# Altium schematic sheet Power_Section.SchDoc
size A; DocumentNumber: 7; SheetNumber: 7; SheetTotal: 8
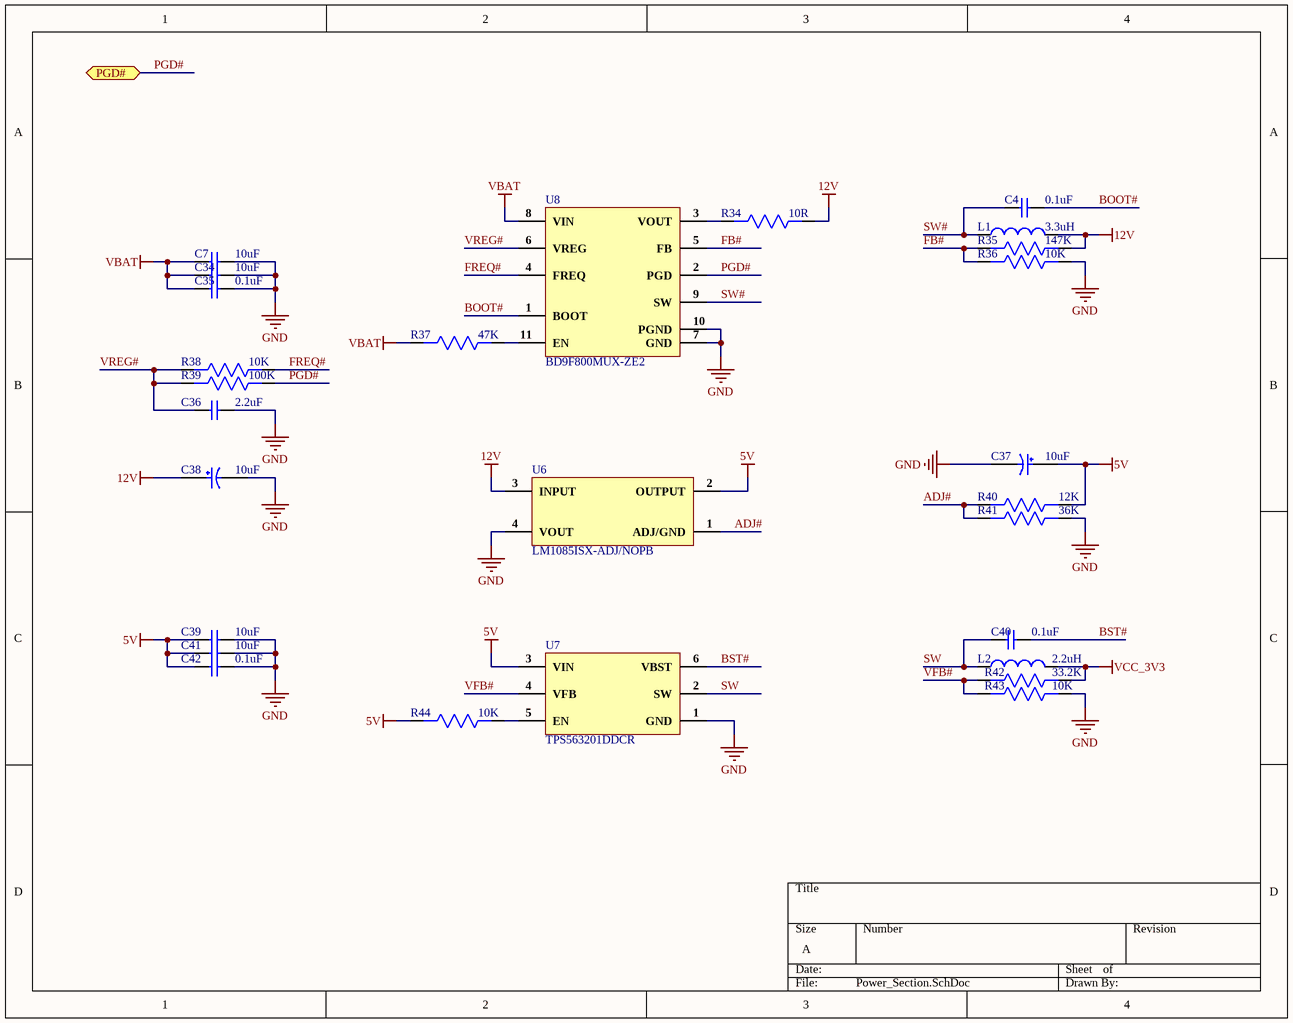
[diagram p0: Power_Section.SchDoc]

## Parts
C4  0.1uF  [CAP 0402]
C7  10uF  [Cap1206]
C34  10uF  [Cap1206]
C35  0.1uF  [CAP 0402]
C36  2.2uF  [Cap0603]
C37  10uF  [Cap Case-A]
C38  10uF  [Cap Tant 2917]
C39  10uF  [Cap0402]
C40  0.1uF  [CAP 0402]
C41  10uF  [Cap0402]
C42  0.1uF  [CAP 0402]
L1  3.3uH  [GCDA1040-3R3MC]
L2  value 2.2uH  [MS0530-2R2M]  (hidden comment: MS0530-2R2M)
R34  10R  [Res0402]
R35  147K  [Res0402]
R36  10K  [Res-0201]
R37  47K  [Res0402]
R38  10K  [Res-0201]
R39  100K  [Res0402]
R40  12K  [Res0402]
R41  36K  [Res0402]
R42  33.2K  [Res0402]
R43  10K  [Res0402]
R44  10K  [Res-0201]
U6  LM1085ISX-ADJ/NOPB  [DDPAK/TO-263-3]
U7  TPS563201DDCR  [TPS563201DDCR]
U8  BD9F800MUX-ZE2

## Ports
PGD# (bidir)

## Nets
5V: C37.1 C39.1 C41.1 C42.1 R40.1 R44.2 U6.2(OUTPUT) U7.3(VIN)
12V: C38.1 L1.2 R34.1 R35.1 U6.3(INPUT)
GND: C7.2 C34.2 C35.2 C36.2 C37.2 C38.2 C39.2 C41.2 C42.2 R36.1 R41.1 R43.1 U6.4(VOUT) U7.1(GND) U8.7(GND) U8.10(PGND)
VBAT: C7.1 C34.1 C35.1 R37.2 U8.8(VIN)
VCC_3V3: L2.2 R42.2
ADJ#: R40.2 R41.2 U6.1(ADJ/GND)
BOOT#: C4.2 U8.1(BOOT)
BST#: C40.2 U7.6(VBST)
FB#: R35.2 R36.2 U8.5(FB)
FREQ#: R38.1 U8.4(FREQ)
PGD#: R39.1 U8.2(PGD) ; port PGD#
SW: C40.1 L2.1 U7.2(SW)
SW#: C4.1 L1.1 U8.9(SW)
VFB#: R42.1 R43.2 U7.4(VFB)
VREG#: C36.1 R38.2 R39.2 U8.6(VREG)
NetR34_2: R34.2 U8.3(VOUT)
NetR37_1: R37.1 U8.11(EN)
NetR44_1: R44.1 U7.5(EN)

## Library data of the parts
C4 C35 C40 C42 = CL05B104KB54PNC: CAP CER 0.1UF 50V X7R 0402; Manufacturer: Samsung; Supplier 1: Digi-Key; Manufacturer Part Number: CL05B104KB54PNC; Stock 1: 8594; Pricing 1: 1=0.1, 10=0.067, 50=0.0366, 100=0.0299, 500=0.02138, 1000=0.01681, 2500=0.01528, 5000=0.01406 (USD); Supplier Part Number 1: 1276-CL05B104KB54PNCDKR-ND
C7 C34 = CL31B106KBHNNNE: CAP CER 10UF 50V X7R 1206; Manufacturer: Samsung; Tolerance: 10%; Supplier 1: Digi-Key; Manufacturer Part Number: CL31B106KBHNNNE; Stock 1: 177239; Pricing 1: 1=0.39, 10=0.268, 50=0.1872, 100=0.1605, 500=0.12038, 1000=0.10166 (USD); Mount: Surface Mount; Case/Package: 1206; Case Code (Metric): 3216; Case Code (Imperial): 1206; Min Operating Temperature: -55°C; Max Operating Temperature: 125°C; Capacitance: 10uF; Dielectric: X7R; Voltage Rating (DC): 50V; Packaging: Tape and Reel; Voltage Rating: 50V; Length: 0.126inch; Width: 0.063inch; Thickness: 0.071inch; Lead Free: Lead Free; ComponentLink1URL: http://www.samsungsem.com/kr/support/product-search/mlcc/CL31B106KBHNNNE.jsp?src-supplier=Digi-Key; ComponentLink1Description: http://www.samsungsem.com/kr/support/product-search/mlcc/CL31B106KBHNNNE.jsp?src-supplier=Digi-Key; Supplier Part Number 1: 1276-6767-1-ND
C36 = GRM188R61E225MA12D: CAP CER 2.2UF 25V X5R 0603; Manufacturer: Murata; Tolerance: 20%; Supplier 1: Digi-Key; Manufacturer Part Number: GRM188R61E225MA12D; Stock 1: 152000; Pricing 1: 4000=0.02107, 8000=0.0196 (USD); Mount: Surface Mount; Case/Package: 0603; Weight: 0.000222oz; Case Code (Metric): 1608; Case Code (Imperial): 0603; Min Operating Temperature: -55°C; Max Operating Temperature: 85°C; Capacitance: 2.2uF; Packaging: Tape and Reel; Voltage Rating: 25V; Dielectric: X5R; Termination: SMD/SMT; Composition: Ceramic; Voltage Rating (DC): 25V; Package Quantity: 4000; Length: 0.063inch; Height: 0.8mm; Width: 0.031inch; Thickness: 0.035inch; ComponentLink1URL: http://search.murata.co.jp/Ceramy/image/img/A01X/G101/ENG/GRM188R61E225MA12-01.pdf?src-supplier=Digi-Key; ComponentLink1Description: http://search.murata.co.jp/Ceramy/image/img/A01X/G101/ENG/GRM188R61E225MA12-01.pdf?src-supplier=Digi-Key; ComponentLink2URL: http://www.mouser.com/ds/2/281/c02e-2905.pdf?src-supplier=Mouser; ComponentLink2Description: http://www.mouser.com/ds/2/281/c02e-2905.pdf?src-supplier=Mouser; Supplier Part Number 1: 490-12738-2-ND
C37 = TAJA106K016RNJ: CAP TANT 10UF 10% 16V 1206; Manufacturer: Kyocera AVX; Dielectric Material: Tantalum; ESR (Equivalent Series Resistance): 3R; Leakage Current: 1.6uA; Dissipation Factor: 8%; Polarity: Polar; Supplier 1: Digi-Key; Manufacturer Part Number: TAJA106K016RNJ; Stock 1: 0; Pricing 1: 1=0.3, 10=0.209, 50=0.1464, 100=0.1254, 500=0.09406, 1000=0.07942 (USD); Mount: Surface Mount,PCB; Case/Package: 1206; Number of Pins: 2; Case Code (Metric): 3216; Case Code (Imperial): 1206; Min Operating Temperature: -55°C; Max Operating Temperature: 125°C; Capacitance: 10uF; Tolerance: 10%; Packaging: Tape and Reel; Voltage Rating (DC): 16V; Package Quantity: 1; Voltage Rating: 16V; Termination: SMD/SMT; Voltage: 16V; Features: General Purpose; Length: 3.2mm; Height: 1.6mm; Depth: 1.6mm; Width: 1.6mm; Height - Seated (Max): 0.071inch; Lead Pitch: 1.1mm; Radiation Hardening: No; Lead Free: Lead Free; REACH SVHC: No SVHC; ComponentLink1URL: http://catalogs.avx.com/TantalumNiobium.pdf?src-supplier=Digi-Key; ComponentLink1Description: http://catalogs.avx.com/TantalumNiobium.pdf?src-supplier=Digi-Key; ComponentLink2URL: http://www.avx.com/docs/catalogs/taj.pdf?src-supplier=Avnet; ComponentLink2Description: http://www.avx.com/docs/catalogs/taj.pdf?src-supplier=Avnet; ComponentLink3URL: http://www.avxcorp.com/docs/Catalogs/taj.pdf?src-supplier=Future+Electronics; ComponentLink3Description: http://www.avxcorp.com/docs/Catalogs/taj.pdf?src-supplier=Future+Electronics; ComponentLink4URL: http://www.farnell.com/datasheets/2237755.pdf?src-supplier=Element14; ComponentLink4Description: http://www.farnell.com/datasheets/2237755.pdf?src-supplier=Element14; ComponentLink5URL: http://www.jameco.com/Jameco/Products/ProdDS/1234933.pdf?src-supplier=Jameco; ComponentLink5Description: http://www.jameco.com/Jameco/Products/ProdDS/1234933.pdf?src-supplier=Jameco; ComponentLink6URL: http://www.mouser.com/ds/2/40/taj-776811.pdf?src-supplier=Mouser; ComponentLink6Description: http://www.mouser.com/ds/2/40/taj-776811.pdf?src-supplier=Mouser; ComponentLink7URL: https://www.distrelec.biz/Web/Downloads/_e/ng/taj_ENG.pdf?mime=application%2Fpdf&src-supplier=Distrelec; ComponentLink7Description: https://www.distrelec.biz/Web/Downloads/_e/ng/taj_ENG.pdf?mime=application%2Fpdf&src-supplier=Distrelec; ComponentLink8URL: http://www.avx.com/docs/Catalogs/taj.pdf?src-supplier=Element14; ComponentLink8Description: http://www.avx.com/docs/Catalogs/taj.pdf?src-supplier=Element14; ComponentLink9URL: https://produktinfo.conrad.com/datenblaetter/550000-574999/559411-da-01-en-TACC_A__3_2_MM_X_1_6_MM_X_1_6_MM__10_UF_.pdf?src-supplier=Conrad; ComponentLink9Description: https://produktinfo.conrad.com/datenblaetter/550000-574999/559411-da-01-en-TACC_A__3_2_MM_X_1_6_MM_X_1_6_MM__10_UF_.pdf?src-supplier=Conrad; Supplier Part Number 1: 478-1655-1-ND
C38 = TAJD106K050RNJ: CAP TANT 10UF 10% 50V 2917; Manufacturer: Kyocera AVX; Dielectric Material: Tantalum; ESR (Equivalent Series Resistance): 800mR; Leakage Current: 5uA; Polarity: Polar; Dissipation Factor: 6%; Supplier 1: Digi-Key; Manufacturer Part Number: TAJD106K050RNJ; Stock 1: 0; Pricing 1: 1=1.84, 10=1.452, 50=1.2584, 100=1.089 (USD); Mount: Surface Mount,PCB; Case/Package: 2917; Number of Pins: 2; Case Code (Metric): 7343; Case Code (Imperial): 2917; Min Operating Temperature: -55°C; Max Operating Temperature: 125°C; Capacitance: 10uF; Tolerance: 10%; Voltage Rating (DC): 50V; Voltage Rating: 50V; Package Quantity: 1; Packaging: Tape and Reel; Termination: SMD/SMT; Voltage: 50V; Features: General Purpose; Length: 7.3mm; Height: 2.9mm; Depth: 4.3mm; Width: 0.169inch; Height - Seated (Max): 0.122inch; Radiation Hardening: No; Lead Free: Lead Free; REACH SVHC: No SVHC; ComponentLink1URL: http://datasheets.avx.com/TAJ.pdf?src-supplier=Digi-Key; ComponentLink1Description: http://datasheets.avx.com/TAJ.pdf?src-supplier=Digi-Key; ComponentLink2URL: http://www.mouser.com/ds/2/40/taj-776811.pdf?src-supplier=Mouser; ComponentLink2Description: http://www.mouser.com/ds/2/40/taj-776811.pdf?src-supplier=Mouser; ComponentLink3URL: http://www.farnell.com/datasheets/49917.pdf?src-supplier=Element14; ComponentLink3Description: http://www.farnell.com/datasheets/49917.pdf?src-supplier=Element14; ComponentLink4URL: http://www.avx.com/docs/Catalogs/taj.pdf?src-supplier=Element14; ComponentLink4Description: http://www.avx.com/docs/Catalogs/taj.pdf?src-supplier=Element14; ComponentLink5URL: http://documents.rs-components.com/techlib://itc_doclist_GB.htm?stockno=6993166&src-supplier=RSComponents; ComponentLink5Description: http://documents.rs-components.com/techlib://itc_doclist_GB.htm?stockno=6993166&src-supplier=RSComponents; ComponentLink6URL: http://www.farnell.com/datasheets/1826076.pdf?src-supplier=Element14; ComponentLink6Description: http://www.farnell.com/datasheets/1826076.pdf?src-supplier=Element14; ComponentLink7URL: http://www.avx.com/docs/catalogs/taj.pdf?src-supplier=Avnet; ComponentLink7Description: http://www.avx.com/docs/catalogs/taj.pdf?src-supplier=Avnet; ComponentLink8URL: https://www.alliedelec.com/m/d/9166fb755e7ffffad4c533f86d810ce4.pdf?src-supplier=Allied+Electronics; ComponentLink8Description: https://www.alliedelec.com/m/d/9166fb755e7ffffad4c533f86d810ce4.pdf?src-supplier=Allied+Electronics; ComponentLink9URL: http://www.avx.com/docs/Catalogs/taj.pdf?src-supplier=Farnell; ComponentLink9Description: http://www.avx.com/docs/Catalogs/taj.pdf?src-supplier=Farnell; Supplier Part Number 1: 478-2380-1-ND
C39 C41 = CL05A106MP8NUB8: CAP CER 10UF 10V X5R 0402; Manufacturer: Samsung; Tolerance: 20%; Supplier 1: Digi-Key; Manufacturer Part Number: CL05A106MP8NUB8; Stock 1: 1158256; Pricing 1: 1=0.45, 10=0.311, 100=0.1863, 500=0.13972, 1000=0.11799, 2500=0.11178 (USD); Mount: Surface Mount; Case/Package: 0402; Case Code (Metric): 1005; Case Code (Imperial): 0402; Min Operating Temperature: -55°C; Max Operating Temperature: 85°C; Packaging: Tape and Reel; Capacitance: 10uF; Voltage Rating: 10V; Length: 0.039inch; Width: 0.02inch; Thickness: 0.035inch; Supplier Part Number 1: 1276-6830-1-ND
L1 = GCDA1040-3R3MC: 3.3uH ±20% 10A 11.8mΩ SMD,11x10.2x4mm Inductors (SMD) RoHS; Manufacturer: GLE; Manufacturer Part No: GCDA1040-3R3MC; Value: 3.3uH; Package: SMD,11x10.2x4mm
L2 = MS0530-2R2M: 2.2uH ±20% 5.5A 29mΩ SMD,5.75x5.2x3mm Inductors (SMD) RoHS; Manufacturer: COILMX; Manufacturer Part No: MS0530-2R2M; Package: Custom
R34 = RC0402JR-0710RL: RES SMD 10 OHM 5% 1/16W 0402; Manufacturer: Yageo; Power Rating: 63mW; Voltage Rating: 50V; Temperature Coefficient: 200ppm/°C; Supplier 1: Digi-Key; Manufacturer Part Number: RC0402JR-0710RL; Stock 1: 1336134; Pricing 1: 1=0.1, 10=0.018, 100=0.0073, 1000=0.0033, 2500=0.0029, 5000=0.0024 (USD); Case/Package: 0402; Case Code (Imperial): 0402; Case Code (Metric): 1005; Min Operating Temperature: -55°C; Max Operating Temperature: 155°C; Resistance: 10R; Tolerance: 5%; Packaging: Tape and Reel; Composition: Thick Film; Package Quantity: 1; Termination: SMD/SMT; Number of Terminations: 2; Military Standard: Not; Max Power Dissipation: 63mW; Working Voltage: 50V; Features: Moisture Resistant; Length: 1mm; Height: 0.016inch; Width: 0.02inch; Depth: 0.5mm; REACH SVHC: Unknown; Lead Free: Lead Free; ComponentLink1URL: http://www.farnell.com/datasheets/1018594.pdf?src-supplier=Element14; ComponentLink1Description: http://www.farnell.com/datasheets/1018594.pdf?src-supplier=Element14; ComponentLink2URL: http://www.yageo.com/documents/recent/PYu-RC_Group_51_RoHS_L_10.pdf?src-supplier=Digi-Key; ComponentLink2Description: http://www.yageo.com/documents/recent/PYu-RC_Group_51_RoHS_L_10.pdf?src-supplier=Digi-Key; ComponentLink3URL: http://www.farnell.com/datasheets/2167052.pdf?src-supplier=Element14; ComponentLink3Description: http://www.farnell.com/datasheets/2167052.pdf?src-supplier=Element14; ComponentLink4URL: http://www.yageo.com/documents/recent/PYu-RC0402_51_RoHS_L_6_r.pdf?src-supplier=Future+Electronics; ComponentLink4Description: http://www.yageo.com/documents/recent/PYu-RC0402_51_RoHS_L_6_r.pdf?src-supplier=Future+Electronics; Supplier Part Number 1: 311-10JRCT-ND
R35 = RC0402FR-07147KL: RES SMD 147K OHM 1% 1/16W 0402; Manufacturer: Yageo; Resistance: 147kR; Power Rating: 62.5mW; Voltage Rating: 50V; Max Power Dissipation: 63mW; Temperature Coefficient: 100ppm/°C; Supplier 1: Digi-Key; Manufacturer Part Number: RC0402FR-07147KL; Stock 1: 250520; Pricing 1: 1=0.1, 10=0.015, 100=0.0062, 1000=0.00278, 2500=0.00242, 5000=0.002 (USD); Case/Package: 0402; Case Code (Imperial): 0402; Case Code (Metric): 1005; Min Operating Temperature: -55°C; Max Operating Temperature: 155°C; Tolerance: 1%; Packaging: Tape and Reel; Composition: Thick Film; Number of Terminations: 2; Termination: SMD/SMT; Military Standard: Not; Voltage Rating (DC): 50V; Features: Moisture Resistant; Length: 1mm; Height: 0.016inch; Width: 0.02inch; Depth: 0.5mm; Lead Free: Lead Free; ComponentLink1URL: https://www.verical.com/server-webapp/html/getDatasheet?partID=329230&src-supplier=Verical; ComponentLink1Description: https://www.verical.com/server-webapp/html/getDatasheet?partID=329230&src-supplier=Verical; ComponentLink2URL: http://www.yageo.com/documents/recent/PYu-RC0402_51_RoHS_L_6_r.pdf?src-supplier=Future+Electronics; ComponentLink2Description: http://www.yageo.com/documents/recent/PYu-RC0402_51_RoHS_L_6_r.pdf?src-supplier=Future+Electronics; Supplier Part Number 1: YAG2981CT-ND
R36 R38 R44 = RC0201JR-0710KL: RES SMD 10K OHM 5% 1/20W 0201; Manufacturer: Yageo; Resistance: 10kR; Temperature Coefficient: 200ppm/°C; Power Rating: 50mW; Voltage Rating: 25V; Supplier 1: Digi-Key; Manufacturer Part Number: RC0201JR-0710KL; Stock 1: 1378070; Pricing 1: 1=0.1, 10=0.028, 100=0.0115, 1000=0.00517, 2500=0.00448, 5000=0.00371 (USD); Case/Package: 0201; Contact Plating: Tin,Matte; Case Code (Imperial): 0201; Case Code (Metric): 0603; Min Operating Temperature: -55°C; Max Operating Temperature: 125°C; Tolerance: 5%; Composition: Thick Film; Packaging: Tape and Reel; Termination: SMD/SMT; Military Standard: Not; Voltage Rating (DC): 25V; Length: 0.6mm; Depth: 0.3mm; Radiation Hardening: No; REACH SVHC: Unknown; Lead Free: Lead Free; ComponentLink1URL: http://www.farnell.com/datasheets/2167052.pdf?src-supplier=Element14; ComponentLink1Description: http://www.farnell.com/datasheets/2167052.pdf?src-supplier=Element14; ComponentLink2URL: http://www.yageo.com/documents/recent/PYu-RC0201_51_RoHS_L_8.pdf?src-supplier=Avnet+Europe; ComponentLink2Description: http://www.yageo.com/documents/recent/PYu-RC0201_51_RoHS_L_8.pdf?src-supplier=Avnet+Europe; ComponentLink3URL: http://www.yageo.com/documents/recent/PYu-RC0201_51_RoHS_L_8.pdf?src-supplier=Avnet; ComponentLink3Description: http://www.yageo.com/documents/recent/PYu-RC0201_51_RoHS_L_8.pdf?src-supplier=Avnet; Supplier Part Number 1: 311-10KNDKR-ND
R37 = ERJ-2RKF4702X: RES SMD 47K OHM 1% 1/10W 0402; Manufacturer: Panasonic; Resistance: 47kR; Temperature Coefficient: 100ppm/°C; Voltage Rating: 50V; Power Rating: 100mW; Supplier 1: Digi-Key; Manufacturer Part Number: ERJ-2RKF4702X; Stock 1: 1741209; Pricing 1: 1=0.1, 10=0.045, 100=0.0183, 1000=0.00822, 2500=0.00713, 5000=0.00589 (USD); Mount: Surface Mount; Case/Package: 0402; Number of Pins: 2; Contact Plating: Tin; Case Code (Imperial): 0402; Case Code (Metric): 1005; Min Operating Temperature: -55°C; Max Operating Temperature: 155°C; Tolerance: 1%; Composition: Thick Film; Packaging: Tape and Reel; Package Quantity: 1; Termination: SMD/SMT; Number of Terminations: 2; Military Standard: Not; Max Power Dissipation: 100mW; Voltage Rating (DC): 50V; Features: Automotive AEC-Q200; Length: 1mm; Height: 0.35mm; Width: 0.5mm; Depth: 0.5mm; Radiation Hardening: No; REACH SVHC: No SVHC; Lead Free: Lead Free; ComponentLink1URL: http://www.farnell.com/datasheets/1911175.pdf?src-supplier=Element14; ComponentLink1Description: http://www.farnell.com/datasheets/1911175.pdf?src-supplier=Element14; ComponentLink2URL: http://industrial.panasonic.com/www-data/pdf/AOA0000/AOA0000CE2.pdf?src-supplier=Avnet; ComponentLink2Description: http://industrial.panasonic.com/www-data/pdf/AOA0000/AOA0000CE2.pdf?src-supplier=Avnet; ComponentLink3URL: http://industrial.panasonic.com/www-data/pdf/AOA0000/AOA0000CE2.pdf?src-supplier=Avnet+Asia; ComponentLink3Description: http://industrial.panasonic.com/www-data/pdf/AOA0000/AOA0000CE2.pdf?src-supplier=Avnet+Asia; ComponentLink4URL: http://www.farnell.com/datasheets/1678782.pdf?src-supplier=Element14; ComponentLink4Description: http://www.farnell.com/datasheets/1678782.pdf?src-supplier=Element14; ComponentLink5URL: http://industrial.panasonic.com/www-data/pdf/AOA0000/AOA0000CE2.pdf?src-supplier=Element14; ComponentLink5Description: http://industrial.panasonic.com/www-data/pdf/AOA0000/AOA0000CE2.pdf?src-supplier=Element14; ComponentLink6URL: https://www.alliedelec.com/m/d/623f45ff1957d936ff56d46fd1c28cac.pdf?src-supplier=Allied+Electronics; ComponentLink6Description: https://www.alliedelec.com/m/d/623f45ff1957d936ff56d46fd1c28cac.pdf?src-supplier=Allied+Electronics; ComponentLink7URL: http://industrial.panasonic.com/cdbs/www-data/pdf/RDA0000/AOA0000C304.pdf?src-supplier=Farnell; ComponentLink7Description: http://industrial.panasonic.com/cdbs/www-data/pdf/RDA0000/AOA0000C304.pdf?src-supplier=Farnell; Supplier Part Number 1: P47.0KLCT-ND
R39 = RC0402FR-07100KL: RES SMD 100K OHM 1% 1/16W 0402; Manufacturer: Yageo; Resistance: 100kR; Temperature Coefficient: 100ppm/°C; Power Rating: 63mW; Voltage Rating: 50V; ComponentLink1URL: http://www.farnell.com/datasheets/2051174.pdf?src-supplier=Element14; ComponentLink1Description: http://www.farnell.com/datasheets/2051174.pdf?src-supplier=Element14; ComponentLink2URL: https://industrial.panasonic.com/ww/system/files/data/download/catalog/id_fixed-resistors_e_1.pdf?src-supplier=Digi-Key; ComponentLink2Description: https://industrial.panasonic.com/ww/system/files/data/download/catalog/id_fixed-resistors_e_1.pdf?src-supplier=Digi-Key; Supplier 1: Digi-Key; Manufacturer Part Number: RC0402FR-07100KL; Stock 1: 21744571; Pricing 1: 1=0.1, 10=0.016, 100=0.0064, 1000=0.0029, 2500=0.0025, 5000=0.0021 (USD); Case/Package: 0402; Case Code (Metric): 1005; Case Code (Imperial): 0402; Min Operating Temperature: -55°C; Max Operating Temperature: 155°C; Composition: Thick Film; Tolerance: 1%; Packaging: Tape and Reel; Package Quantity: 1; Number of Terminations: 2; Termination: SMD/SMT; Military Standard: Not; Max Power Dissipation: 63mW; Working Voltage: 50V; Features: Moisture Resistant; Length: 0.039inch; Height: 0.016inch; Width: 0.02inch; Depth: 0.5mm; REACH SVHC: No SVHC; Lead Free: Lead Free; ComponentLink3URL: http://www.yageo.com/documents/recent/PYu-RC_Group_51_RoHS_L_10.pdf?src-supplier=Digi-Key; ComponentLink3Description: http://www.yageo.com/documents/recent/PYu-RC_Group_51_RoHS_L_10.pdf?src-supplier=Digi-Key; ComponentLink4URL: http://www.farnell.com/datasheets/1018594.pdf?src-supplier=Element14; ComponentLink4Description: http://www.farnell.com/datasheets/1018594.pdf?src-supplier=Element14; ComponentLink5URL: http://www.yageo.com/documents/recent/PYu-RC_Group_51_RoHS_L_9.pdf?src-supplier=Verical; ComponentLink5Description: http://www.yageo.com/documents/recent/PYu-RC_Group_51_RoHS_L_9.pdf?src-supplier=Verical; ComponentLink6URL: http://www.yageo.com/documents/recent/PYu-RC_Group_51_RoHS_L_9.pdf?src-supplier=Mouser; ComponentLink6Description: http://www.yageo.com/documents/recent/PYu-RC_Group_51_RoHS_L_9.pdf?src-supplier=Mouser; ComponentLink7URL: http://documents.rs-components.com/techlib://itc_doclist_GB.htm?stockno=6185797&src-supplier=RSComponents; ComponentLink7Description: http://documents.rs-components.com/techlib://itc_doclist_GB.htm?stockno=6185797&src-supplier=RSComponents; Supplier Part Number 1: 311-100KLRDKR-ND
R40 = RC0402FR-0712KL: RES SMD 12K OHM 1% 1/16W 0402; Manufacturer: Yageo; Resistance: 12kR; Power Rating: 62.5mW; Voltage Rating: 50V; Max Power Dissipation: 63mW; Temperature Coefficient: 100ppm/°C; Supplier 1: Digi-Key; Manufacturer Part Number: RC0402FR-0712KL; Stock 1: 382952; Pricing 1: 1=0.1, 10=0.015, 100=0.0062, 1000=0.00278, 2500=0.00242, 5000=0.002 (USD); Case/Package: 0402; Weight: 2.3E-05oz; Case Code (Metric): 1005; Case Code (Imperial): 0402; Min Operating Temperature: -55°C; Max Operating Temperature: 155°C; Packaging: Tape and Reel; Tolerance: 1%; Package Quantity: 1; Composition: Thick Film; Number of Terminations: 2; Termination: SMD/SMT; Military Standard: Not; Features: Moisture Resistant; Length: 1mm; Height: 0.016inch; Width: 0.02inch; Depth: 0.5mm; REACH SVHC: No SVHC; Lead Free: Lead Free; ComponentLink1URL: http://www.yageo.com/documents/recent/PYu-RC_Group_51_RoHS_L_10.pdf?src-supplier=Digi-Key; ComponentLink1Description: http://www.yageo.com/documents/recent/PYu-RC_Group_51_RoHS_L_10.pdf?src-supplier=Digi-Key; ComponentLink2URL: http://www.mouser.com/ds/2/447/PYu-RC0402_51_RoHS_L_6_r-8721.pdf?src-supplier=Mouser; ComponentLink2Description: http://www.mouser.com/ds/2/447/PYu-RC0402_51_RoHS_L_6_r-8721.pdf?src-supplier=Mouser; ComponentLink3URL: http://www.farnell.com/datasheets/2167052.pdf?src-supplier=Element14; ComponentLink3Description: http://www.farnell.com/datasheets/2167052.pdf?src-supplier=Element14; ComponentLink4URL: http://www.yageo.com/documents/recent/PYu-RC0402_51_RoHS_L_6_r.pdf?src-supplier=Future+Electronics; ComponentLink4Description: http://www.yageo.com/documents/recent/PYu-RC0402_51_RoHS_L_6_r.pdf?src-supplier=Future+Electronics; ComponentLink5URL: http://www.farnell.com/datasheets/1018594.pdf?src-supplier=Element14; ComponentLink5Description: http://www.farnell.com/datasheets/1018594.pdf?src-supplier=Element14; Supplier Part Number 1: 311-12.0KLRCT-ND
R41 = ERJ-2RKF3602X: RES SMD 36K OHM 1% 1/10W 0402; Manufacturer: Panasonic; Voltage Rating: 50V; Resistance: 36kR; Power Rating: 100mW; Temperature Coefficient: 100ppm/°C; Supplier 1: Digi-Key; Manufacturer Part Number: ERJ-2RKF3602X; Stock 1: 23916; Pricing 1: 1=0.1, 10=0.032, 100=0.0132, 1000=0.00591, 2500=0.00513, 5000=0.00424 (USD); Mount: Surface Mount; Case/Package: 0402; Case Code (Imperial): 0402; Case Code (Metric): 1005; Contact Plating: Tin; Min Operating Temperature: -55°C; Max Operating Temperature: 155°C; Packaging: Tape and Reel; Tolerance: 1%; Package Quantity: 1; Termination: SMD/SMT; Composition: Thick Film; Number of Terminations: 2; Military Standard: Not; Max Power Dissipation: 100mW; Voltage Rating (DC): 50V; Features: Automotive AEC-Q200; Length: 1mm; Height: 0.35mm; Width: 0.5mm; Depth: 0.5mm; REACH SVHC: No SVHC; Lead Free: Lead Free; ComponentLink1URL: http://www.farnell.com/datasheets/1678782.pdf?src-supplier=Element14; ComponentLink1Description: http://www.farnell.com/datasheets/1678782.pdf?src-supplier=Element14; ComponentLink2URL: https://www.alliedelec.com/m/d/623f45ff1957d936ff56d46fd1c28cac.pdf?src-supplier=Allied+Electronics; ComponentLink2Description: https://www.alliedelec.com/m/d/623f45ff1957d936ff56d46fd1c28cac.pdf?src-supplier=Allied+Electronics; ComponentLink3URL: http://industrial.panasonic.com/www-data/pdf/AOA0000/AOA0000CE2.pdf?src-supplier=Avnet; ComponentLink3Description: http://industrial.panasonic.com/www-data/pdf/AOA0000/AOA0000CE2.pdf?src-supplier=Avnet; Supplier Part Number 1: P36.0KLCT-ND
R42 = RC0402FR-0733K2L: RES SMD 33.2K OHM 1% 1/16W 0402; Manufacturer: Yageo; Resistance: 33.2kR; Power Rating: 62.5mW; Voltage Rating: 50V; Temperature Coefficient: 100ppm/°C; Supplier 1: Digi-Key; Manufacturer Part Number: RC0402FR-0733K2L; Stock 1: 577926; Pricing 1: 1=0.1, 10=0.016, 100=0.0064, 1000=0.00289, 2500=0.00251, 5000=0.00207 (USD); Case/Package: 0402; Case Code (Imperial): 0402; Case Code (Metric): 1005; Min Operating Temperature: -55°C; Max Operating Temperature: 155°C; Packaging: Tape and Reel; Tolerance: 1%; Termination: SMD/SMT; Military Standard: Not; Composition: Thick Film; Working Voltage: 50V; Number of Terminations: 2; Length: 1mm; Depth: 0.5mm; Lead Free: Lead Free; ComponentLink1URL: http://www.yageo.com/documents/recent/PYu-RC0402_51_RoHS_L_6_r.pdf?src-supplier=Future+Electronics; ComponentLink1Description: http://www.yageo.com/documents/recent/PYu-RC0402_51_RoHS_L_6_r.pdf?src-supplier=Future+Electronics; ComponentLink2URL: http://www.mouser.com/ds/2/447/PYu-RC0402_51_RoHS_L_6_r-8721.pdf?src-supplier=Mouser; ComponentLink2Description: http://www.mouser.com/ds/2/447/PYu-RC0402_51_RoHS_L_6_r-8721.pdf?src-supplier=Mouser; Supplier Part Number 1: 311-33.2KLRDKR-ND
R43 = RC0402FR-0710KL: RES SMD 10K OHM 1% 1/16W 0402; Manufacturer: Yageo Phycomp; Temperature Coefficient: 100ppm/°C; Resistance: 10000R; Voltage Rating (DC): 50V; Power Rating: 63mW; Supplier 1: Digi-Key; Manufacturer Part Number: RC0402FR-0710KL; Stock 1: 98435877; Pricing 1: 1=0.1, 10=0.016, 100=0.0067, 1000=0.00301, 2500=0.00261, 5000=0.00215 (USD); Mount: Surface Mount; Case/Package: 0402; Number of Pins: 2; Min Operating Temperature: -55°C; Max Operating Temperature: 155°C; Tolerance: 1%; Packaging: Cut Tape; Length: 1mm; Height: 0.32mm; Width: 500um; Depth: 0.5mm; REACH SVHC: No SVHC; Lead Free: Lead Free; Supplier Part Number 1: 311-10.0KLRCT-ND
U6 = LM1085ISX-ADJ/NOPB: IC REG LIN POS ADJ 3A DDPAK; Manufacturer: TI National Semiconductor; Max Input Voltage: 29V; Min Input Voltage: 2.6V; Number of Outputs: 1; Polarity: Positive; Quiescent Current: 10mA; Output Type: Adjustable; Dropout Voltage: 1.3V; Output Voltage: 15V; Min Current Limit: 3.2A; Reference Voltage: 1.262V; Min Output Voltage: 1.2V; Supplier 1: Digi-Key; Manufacturer Part Number: LM1085ISX-ADJ/NOPB; Stock 1: 1880; Pricing 1: 1=1.77, 10=1.59, 25=1.5, 100=1.2, 250=1.05 (USD); Mount: Surface Mount; Case/Package: TO-263; Number of Pins: 3; Contact Plating: Tin,Matte; Min Operating Temperature: -40°C; Max Operating Temperature: 125°C; Max Output Current: 3A; Packaging: Tape and Reel; Package Quantity: 500; Output Current: 3A; Number of Regulators: 1; Max Output Voltage: 15V; Radiation Hardening: No; REACH SVHC: No SVHC; Lead Free: Contains Lead; ComponentLink1URL: http://www.ti.com/lit/ds/symlink/lm1085.pdf?src-supplier=Digi-Key; ComponentLink1Description: http://www.ti.com/lit/ds/symlink/lm1085.pdf?src-supplier=Digi-Key; ComponentLink2URL: http://www.produktinfo.conrad.com/datenblaetter/1000000-1099999/001013601-da-01-en-IC_REG_L_LM1085ISX_ADJ_NOPB_TO_263_3_TID.pdf?src-supplier=Conrad; ComponentLink2Description: http://www.produktinfo.conrad.com/datenblaetter/1000000-1099999/001013601-da-01-en-IC_REG_L_LM1085ISX_ADJ_NOPB_TO_263_3_TID.pdf?src-supplier=Conrad; Supplier Part Number 1: LM1085ISX-ADJ/NOPBCT-ND
U7 = TPS563201DDCR: IC REG BUCK ADJ 3A TSOT23-6; Manufacturer: Texas Instruments; Number of Outputs: 1; Min Input Voltage: 4.5V; Max Input Voltage: 17V; Min Output Voltage: 768mV; Max Output Voltage: 7V; Switching Frequency: 580kHz; Synchronous Rectifier: Yes; Quiescent Current: 400uA; Output Type: Adjustable; Output Configuration: Positive; Supplier 1: Digi-Key; Manufacturer Part Number: TPS563201DDCR; Stock 1: 0; Pricing 1: 1=0.92, 10=0.812, 25=0.7628, 100=0.5781, 250=0.492, 500=0.4674, 1000=0.3567 (USD); Mount: Surface Mount; Case/Package: SOT-23-6; Number of Pins: 6; Min Operating Temperature: -40°C; Max Operating Temperature: 125°C; Packaging: Tape and Reel; Output Current: 3A; Lead Free: Lead Free; ComponentLink1URL: http://www.ti.com/lit/ds/symlink/tps563201.pdf?src-supplier=Digi-Key; ComponentLink1Description: http://www.ti.com/lit/ds/symlink/tps563201.pdf?src-supplier=Digi-Key; ComponentLink2URL: http://www.ti.com/general/docs/suppproductinfo.tsp?distId=10&amp;gotoUrl=http%3A%2F%2Fwww.ti.com%2Flit%2Fgpn%2Ftps563201&src-supplier=Digi-Key; ComponentLink2Description: http://www.ti.com/general/docs/suppproductinfo.tsp?distId=10&amp;gotoUrl=http%3A%2F%2Fwww.ti.com%2Flit%2Fgpn%2Ftps563201&src-supplier=Digi-Key; ComponentLink3URL: http://www.ti.com/lit/gpn/tps563201?src-supplier=Mouser; ComponentLink3Description: http://www.ti.com/lit/gpn/tps563201?src-supplier=Mouser; Supplier Part Number 1: 296-47238-6-ND
U8 = BD9F800MUX-ZE2: 4.5V TO 28V INPUT, 8.0A INTEGRAT; Manufacturer: Rohm; Supplier 1: Digi-Key; Manufacturer Part Number: BD9F800MUX-ZE2; Stock 1: 2040; Pricing 1: 1=2.76, 10=2.475, 25=2.3352, 100=1.868, 250=1.63452, 500=1.5878, 1000=1.3076 (USD); Supplier Part Number 1: 846-BD9F800MUX-ZE2CT-ND